# Altium schematic sheet SENSOSR.SchDoc: SCH16T Breakout borad
size A4; DrawnBy: Parsa Malekpour; Revision: V1.0; SheetNumber: 1; SheetTotal: 1
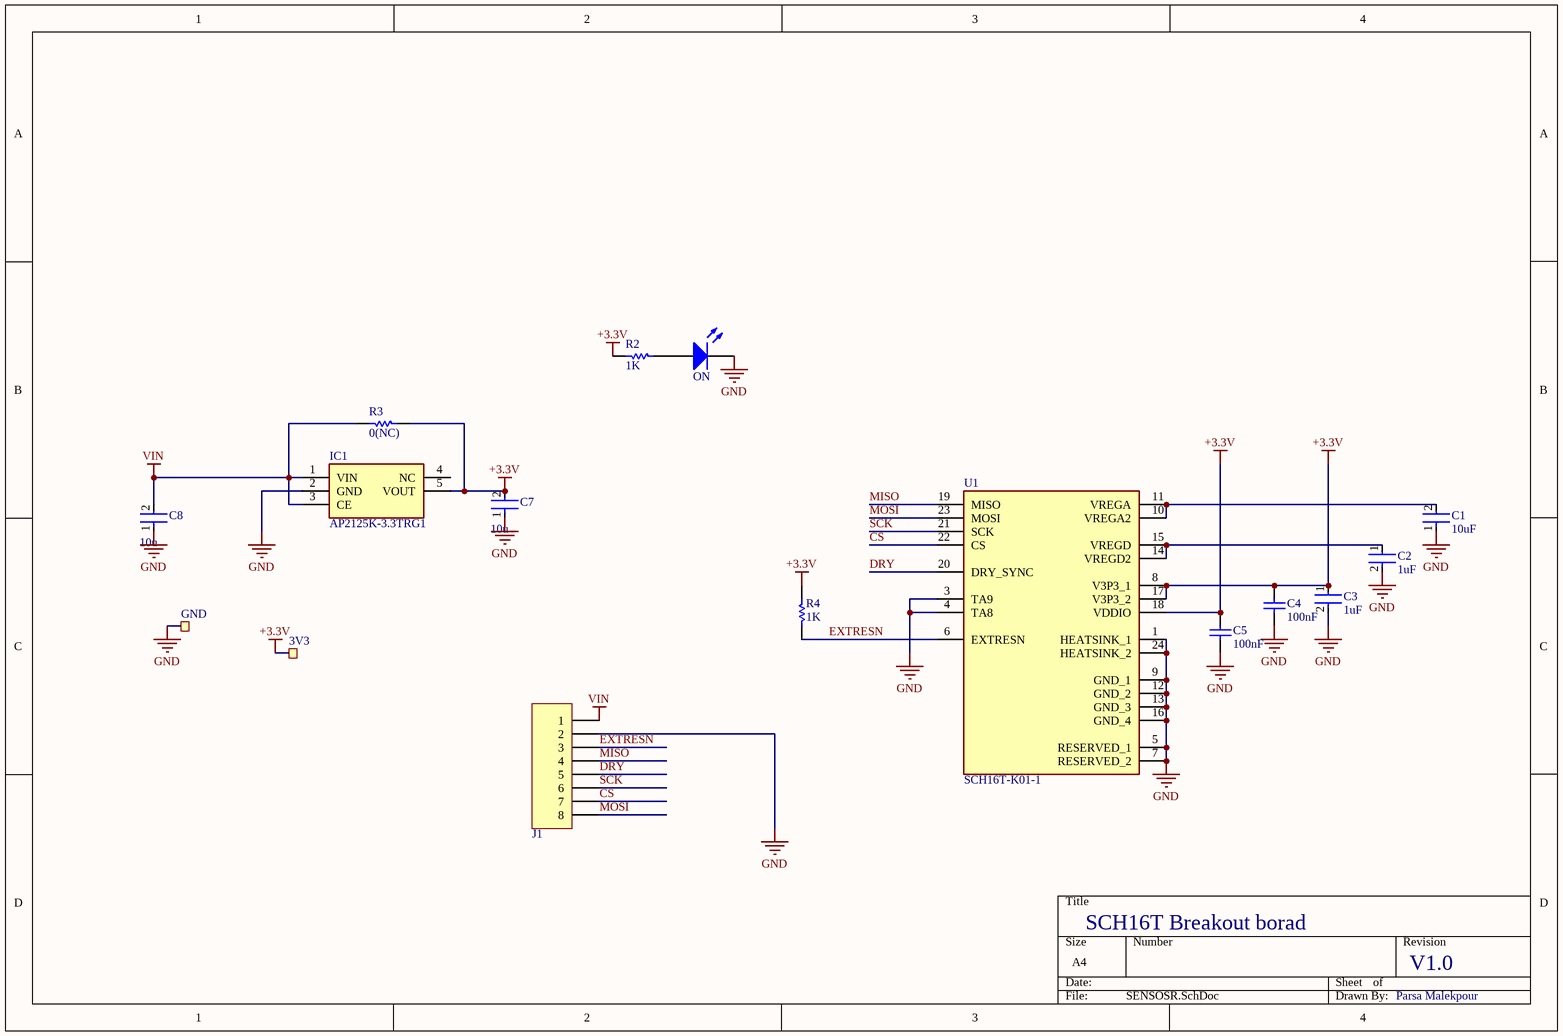
[diagram p0: SENSOSR.SchDoc]

## Parts
3V3  Ø1.5mm,SMD  [TP_SMD_Ø1.5mm]  (value not drawn)  (no BOM)
C1  Capacitance: 10uF  [FP-C1608-080-IPC_A]  (hidden comment: C1608X5R1E106M080AC)
C2  Capacitance: 1uF  [FP-C1608-080-0_1-IPC_C]  (hidden comment: C1608X7R1E105K080AB)
C3  Capacitance: 1uF  [FP-C1608-080-0_1-IPC_C]  (hidden comment: C1608X7R1E105K080AB)
C4  Capacitance: 100nF  [CAPC1608X90X35ML10T15]  (hidden comment: GRM188R71H104KA93D)
C5  Capacitance: 100nF  [CAPC1608X90X35ML10T15]  (hidden comment: GRM188R71H104KA93D)
C7  value 10u  [FP-C1608-080-IPC_A]  (hidden comment: C1608X5R1E106M080AC)
C8  value 10u  [FP-C1608-080-IPC_A]  (hidden comment: C1608X5R1E106M080AC)
GND  Ø1.5mm,SMD  [TP_SMD_Ø1.5mm]  (value not drawn)  (no BOM)
IC1  AP2125K-3.3TRG1  [SOT95P282X145-5N]
J1  CONN-8  [PHDR8]  (value not drawn)
ON  LED  [led-0603]  (value not drawn)
R2  1K  [R0603]
R3  0(NC)  [R0603]
R4  1K  [R0603]
U1  SCH16T-K01-1  [SCH16TK011]

## Nets
+3.3V: 3V3.1 C3.1 C4.1 C5.1 C7.2 IC1.5(VOUT) R2.2 R3.1 R4.1 U1.8(V3P3_1) U1.17(V3P3_2) U1.18(VDDIO)
GND: C1.1 C2.2 C3.2 C4.2 C5.2 C7.1 C8.1 GND.1 IC1.2(GND) J1.2 ON.2(K) U1.1(HEATSINK_1) U1.3(TA9) U1.4(TA8) U1.5(RESERVED_1) U1.7(RESERVED_2) U1.9(GND_1) U1.12(GND_2) U1.13(GND_3) U1.16(GND_4) U1.24(HEATSINK_2)
VIN: C8.2 IC1.1(VIN) IC1.3(CE) J1.1 R3.2
CS: J1.7 U1.22(CS)
DRY: J1.5 U1.20(DRY_SYNC)
EXTRESN: J1.3 R4.2 U1.6(EXTRESN)
MISO: J1.4 U1.19(MISO)
MOSI: J1.8 U1.23(MOSI)
SCK: J1.6 U1.21(SCK)
NetC1_2: C1.2 U1.10(VREGA2) U1.11(VREGA)
NetC2_1: C2.1 U1.14(VREGD2) U1.15(VREGD)
NetON_1: ON.1(A) R2.1

Not connected (* = marked no-connect by the designer): IC1 4(NC)

## Library data of the parts
3V3 GND = TP_SMD_Ø1.5MM: 1.5mm circular SMD testpad; Manufacturer: Nordic Semiconductor; Manufacturer Part Number: N.A.; Pad Count: 1; Part Number: TP_SMD_Ø1.5MM; LatestRevisionDate: 2016-06-02; Published: 2016-06-02; Value: Ø1.5mm,SMD; Note: N.A.; Artikkelnr Noca: N.A.; Footprint Doc: TP_SMD_Ø1.5mm; Part number IPS: N.A.; ComponentLink1URL: N.A.; ComponentLink1Description: Datasheet; ComponentLink2URL: N.A.; ComponentLink2Description: Supplier link; HelpURL: N.A.; Supplier 1: N.A.; Supplier Part Number 1: N.A.; Supplier 2: N.A.; Supplier Part Number 2: N.A.; Component Class: Connectors; PartId: 100500477
C1 = CMP-2000-05442-2: CAP CER 10UF 25V X5R 0603; Dielectric Material: Ceramic; Tolerance: 20%; Value: 10u; Dielectric: X5R; Length: 1.6mm; Termination: SMD/SMT; Depth: 0.8mm; RoHS Compliant: Yes; Construction: Flat; Weight: 7.1E-05oz; Thickness: 0.039inch; Packaging: Tape and Reel; Min Operating Temperature: -55°C; Case Code (Imperial): 0603; Case/Package: 0603; Height: 0.8mm; Case Code (Metric): 1608; Voltage Rating: 25V; Resistor Type: Ceramic; Voltage Rating (DC): 25V; Max Operating Temperature: 85°C; REACH SVHC: No SVHC; Lead Free: Lead Free; Series: C; Width: 0.8mm; Mount: Surface Mount; Package Quantity: 1
C2 C3 = CMP-08246-005723-1: Multilayer Ceramic Capacitors 1μF ±10% 25V X7R SMD 0603; Value: 1u; Mount: Surface Mount; Series: C; Tolerance: 10%; RoHS Compliant: Yes; Packaging: Tape and Reel; Case Code (Imperial): 0603; Height: 0.8mm; Case/Package: 0603; REACH SVHC: No SVHC; Thickness: 0.037inch; Voltage: 25V; Voltage Rating (DC): 25V; Construction: Flat; Case Code (Metric): 1608; Radiation Hardening: No; Package Quantity: 4000; Weight: 7.1E-05oz; Width: 0.031inch; Resistor Type: Ceramic; Termination: SMD/SMT; Depth: 0.8mm; Lead Free: Lead Free; Min Operating Temperature: -55°C; Length: 1.6mm; Dielectric: X7R; Max Operating Temperature: 125°C; Voltage Rating: 25V; Dielectric Material: Ceramic
C4 C5 = CMP-2100-03643-1: Chip Capacitor, 0.1 uF, +/- 10%, 50 V, -55 to 125 degC, 0603 (1608 Metric), RoHS, Tape and Reel; Manufacturer: Murata; Dielectric Material: Ceramic; Voltage Rating: 50V; Dielectric: X7R; Insulation Resistance: 10GR; Value: 100n; Case Code (Metric): 1608; Lead Free: LeadFree; Depth: 0.8mm; Number of Pins: 2; Radiation Hardening: No; Case/Package: 0603; Manufacturer URL: http://www.murata.com/; Packaging: TapeandReel; Length: 1.6mm; Contact Plating: Tin; Datasheet URL: http://psearch.en.murata.com/capacitor/product/GRM188R71H104KA93%23.pdf; Tolerance: 10%; Case Code (Imperial): 0603; Min Operating Temperature: -55degC; RoHSCompliant: true; Voltage: 50V; Termination: SMD/SMT; Mount: SurfaceMount; Material: Ceramic; Package Quantity: 1; Height: 0.8mm; Thickness: 0.035inch; REACH SVHC: NoSVHC; Max Operating Temperature: 125degC; Width: 0.8mm; Package Reference: 0603; Voltage Rating (DC): 50V; Datasheet Version: 42675.0; Package Description: 2-Pin Surface Mount Device, Body 1.6 x 0.8 mm
C7 C8 = CMP-2000-05442-2: CAP CER 10UF 25V X5R 0603; Dielectric Material: Ceramic; Tolerance: 20%; Dielectric: X5R; Length: 1.6mm; Termination: SMD/SMT; Depth: 0.8mm; RoHS Compliant: Yes; Construction: Flat; Weight: 7.1E-05oz; Thickness: 0.039inch; Packaging: Tape and Reel; Min Operating Temperature: -55°C; Case Code (Imperial): 0603; Case/Package: 0603; Height: 0.8mm; Case Code (Metric): 1608; Voltage Rating: 25V; Resistor Type: Ceramic; Voltage Rating (DC): 25V; Max Operating Temperature: 85°C; REACH SVHC: No SVHC; Lead Free: Lead Free; Series: C; Width: 0.8mm; Mount: Surface Mount; Package Quantity: 1; Capacitance: 10uF
IC1 = AP2125K-3.3TRG1: Integrated Circuit; Manufacturer_Name: Diodes Incorporated; Datasheet Link: https://www.diodes.com//assets/Datasheets/AP2125.pdf; Height: 1.45mm; Manufacturer_Part_Number: AP2125K-3.3TRG1; Mouser Part Number: 621-AP2125K-3.3TRG1; Mouser Price/Stock: https://www.mouser.co.uk/ProductDetail/Diodes-Incorporated/AP2125K-3.3TRG1?qs=x6A8l6qLYDC5mCIw9pxEEw%3D%3D; Arrow Part Number: AP2125K-3.3TRG1; Arrow Price/Stock: https://www.arrow.com/en/products/ap2125k-3.3trg1/diodes-incorporated?region=nac
R2-R4 = Resistor: Designer: Parsa Malekpour
  R2 R4: Value: 1K
  R3: Value: 0(NC)
U1 = SCH16T-K01-1: Undefined or Miscellaneous; Manufacturer_Name: Murata Electronics; Datasheet Link: https://www.murata.com/-/media/webrenewal/products/sensor/pdf/datasheet/datasheet-sch16t-series-short.ashx?la=en-us&cvid=20240110024121000000; Height: 3mm; Manufacturer_Part_Number: SCH16T-K01-1; Mouser Part Number: 81-SCH16T-K01-1; Mouser Price/Stock: https://www.mouser.co.uk/ProductDetail/Murata-Electronics/SCH16T-K01-1?qs=HFfMDpzxxd0hctvcENbFhg%3D%3D; Arrow Part Number: SCH16T-K01-1; Arrow Price/Stock: https://www.arrow.com/en/products/sch16t-k01-1/murata-manufacturing?utm_currency=USD&region=nac